# EasyEDA Pro project ProPrj_K230_2026-10-28.epro, schematic 主板原理图, sheets 11 to 13 of 13

## Sheets
11 Power-0V8-1V1-1V8-3V3: Page Name: Power-0V8-1V1-1V8-3V3; Update Date: 2024-11-28
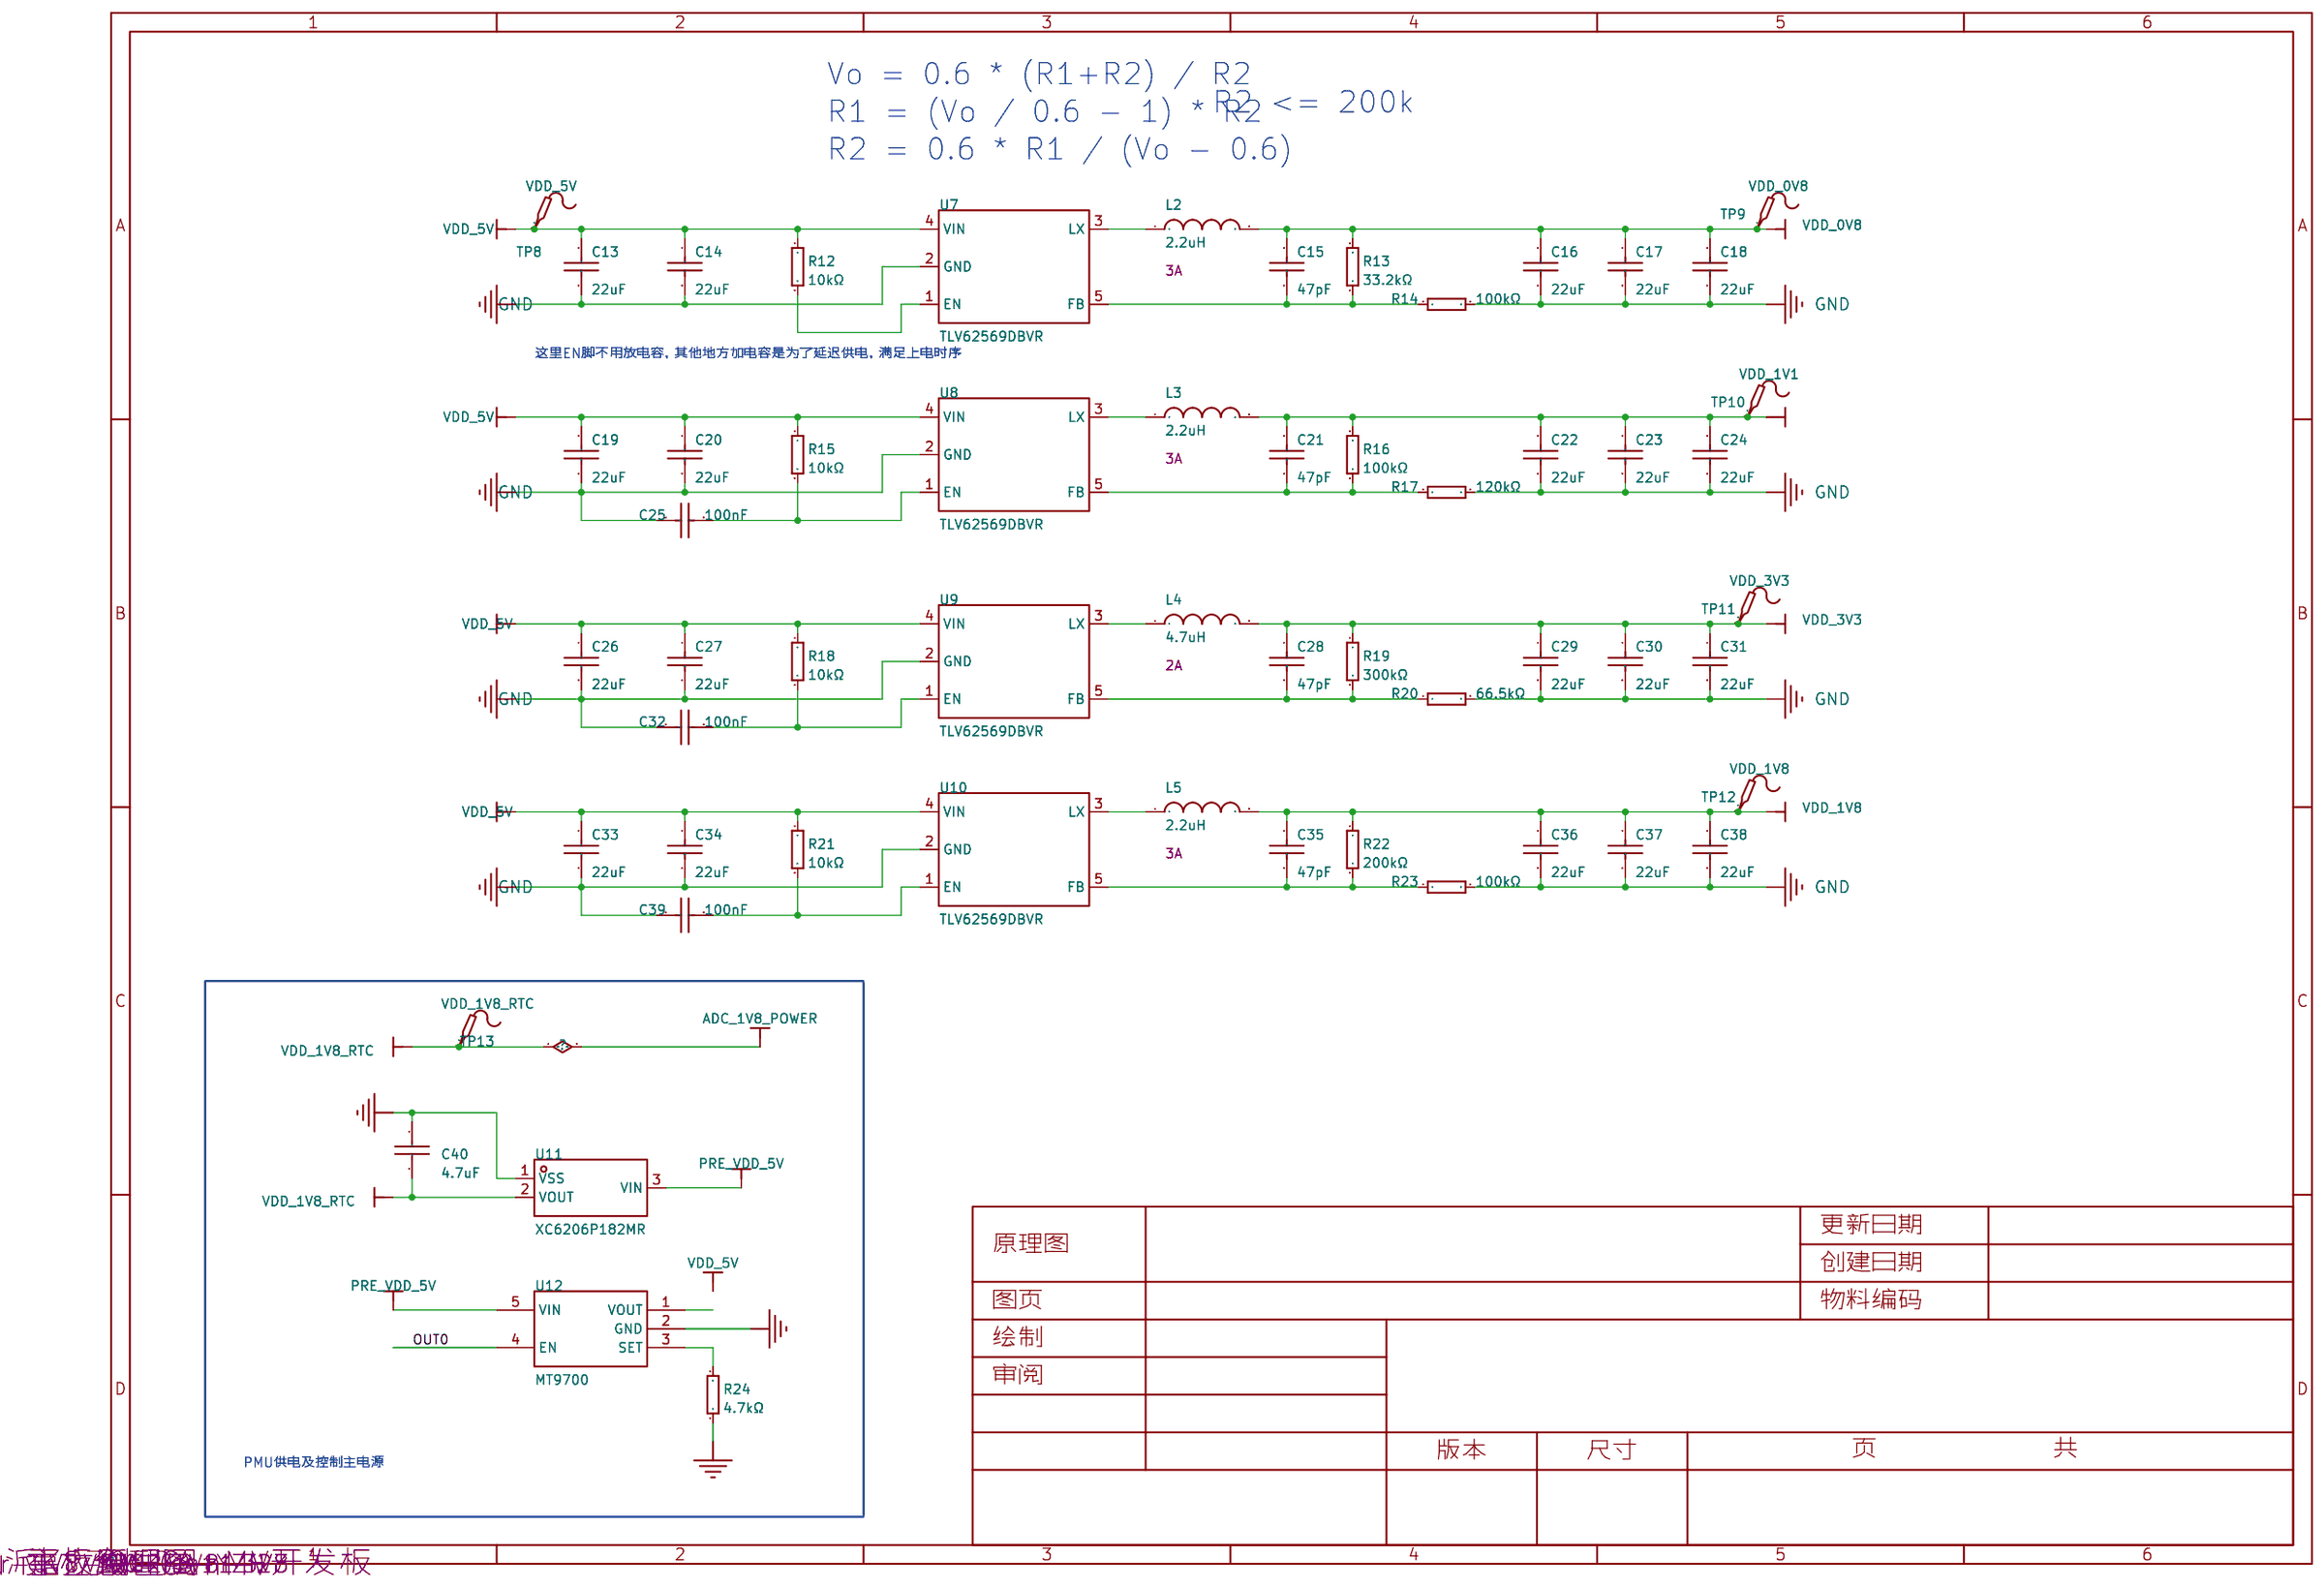
[diagram p10: Power-0V8-1V1-1V8-3V3]
12 K230 POWER: Page Name: K230 POWER; Update Date: 2024-11-28
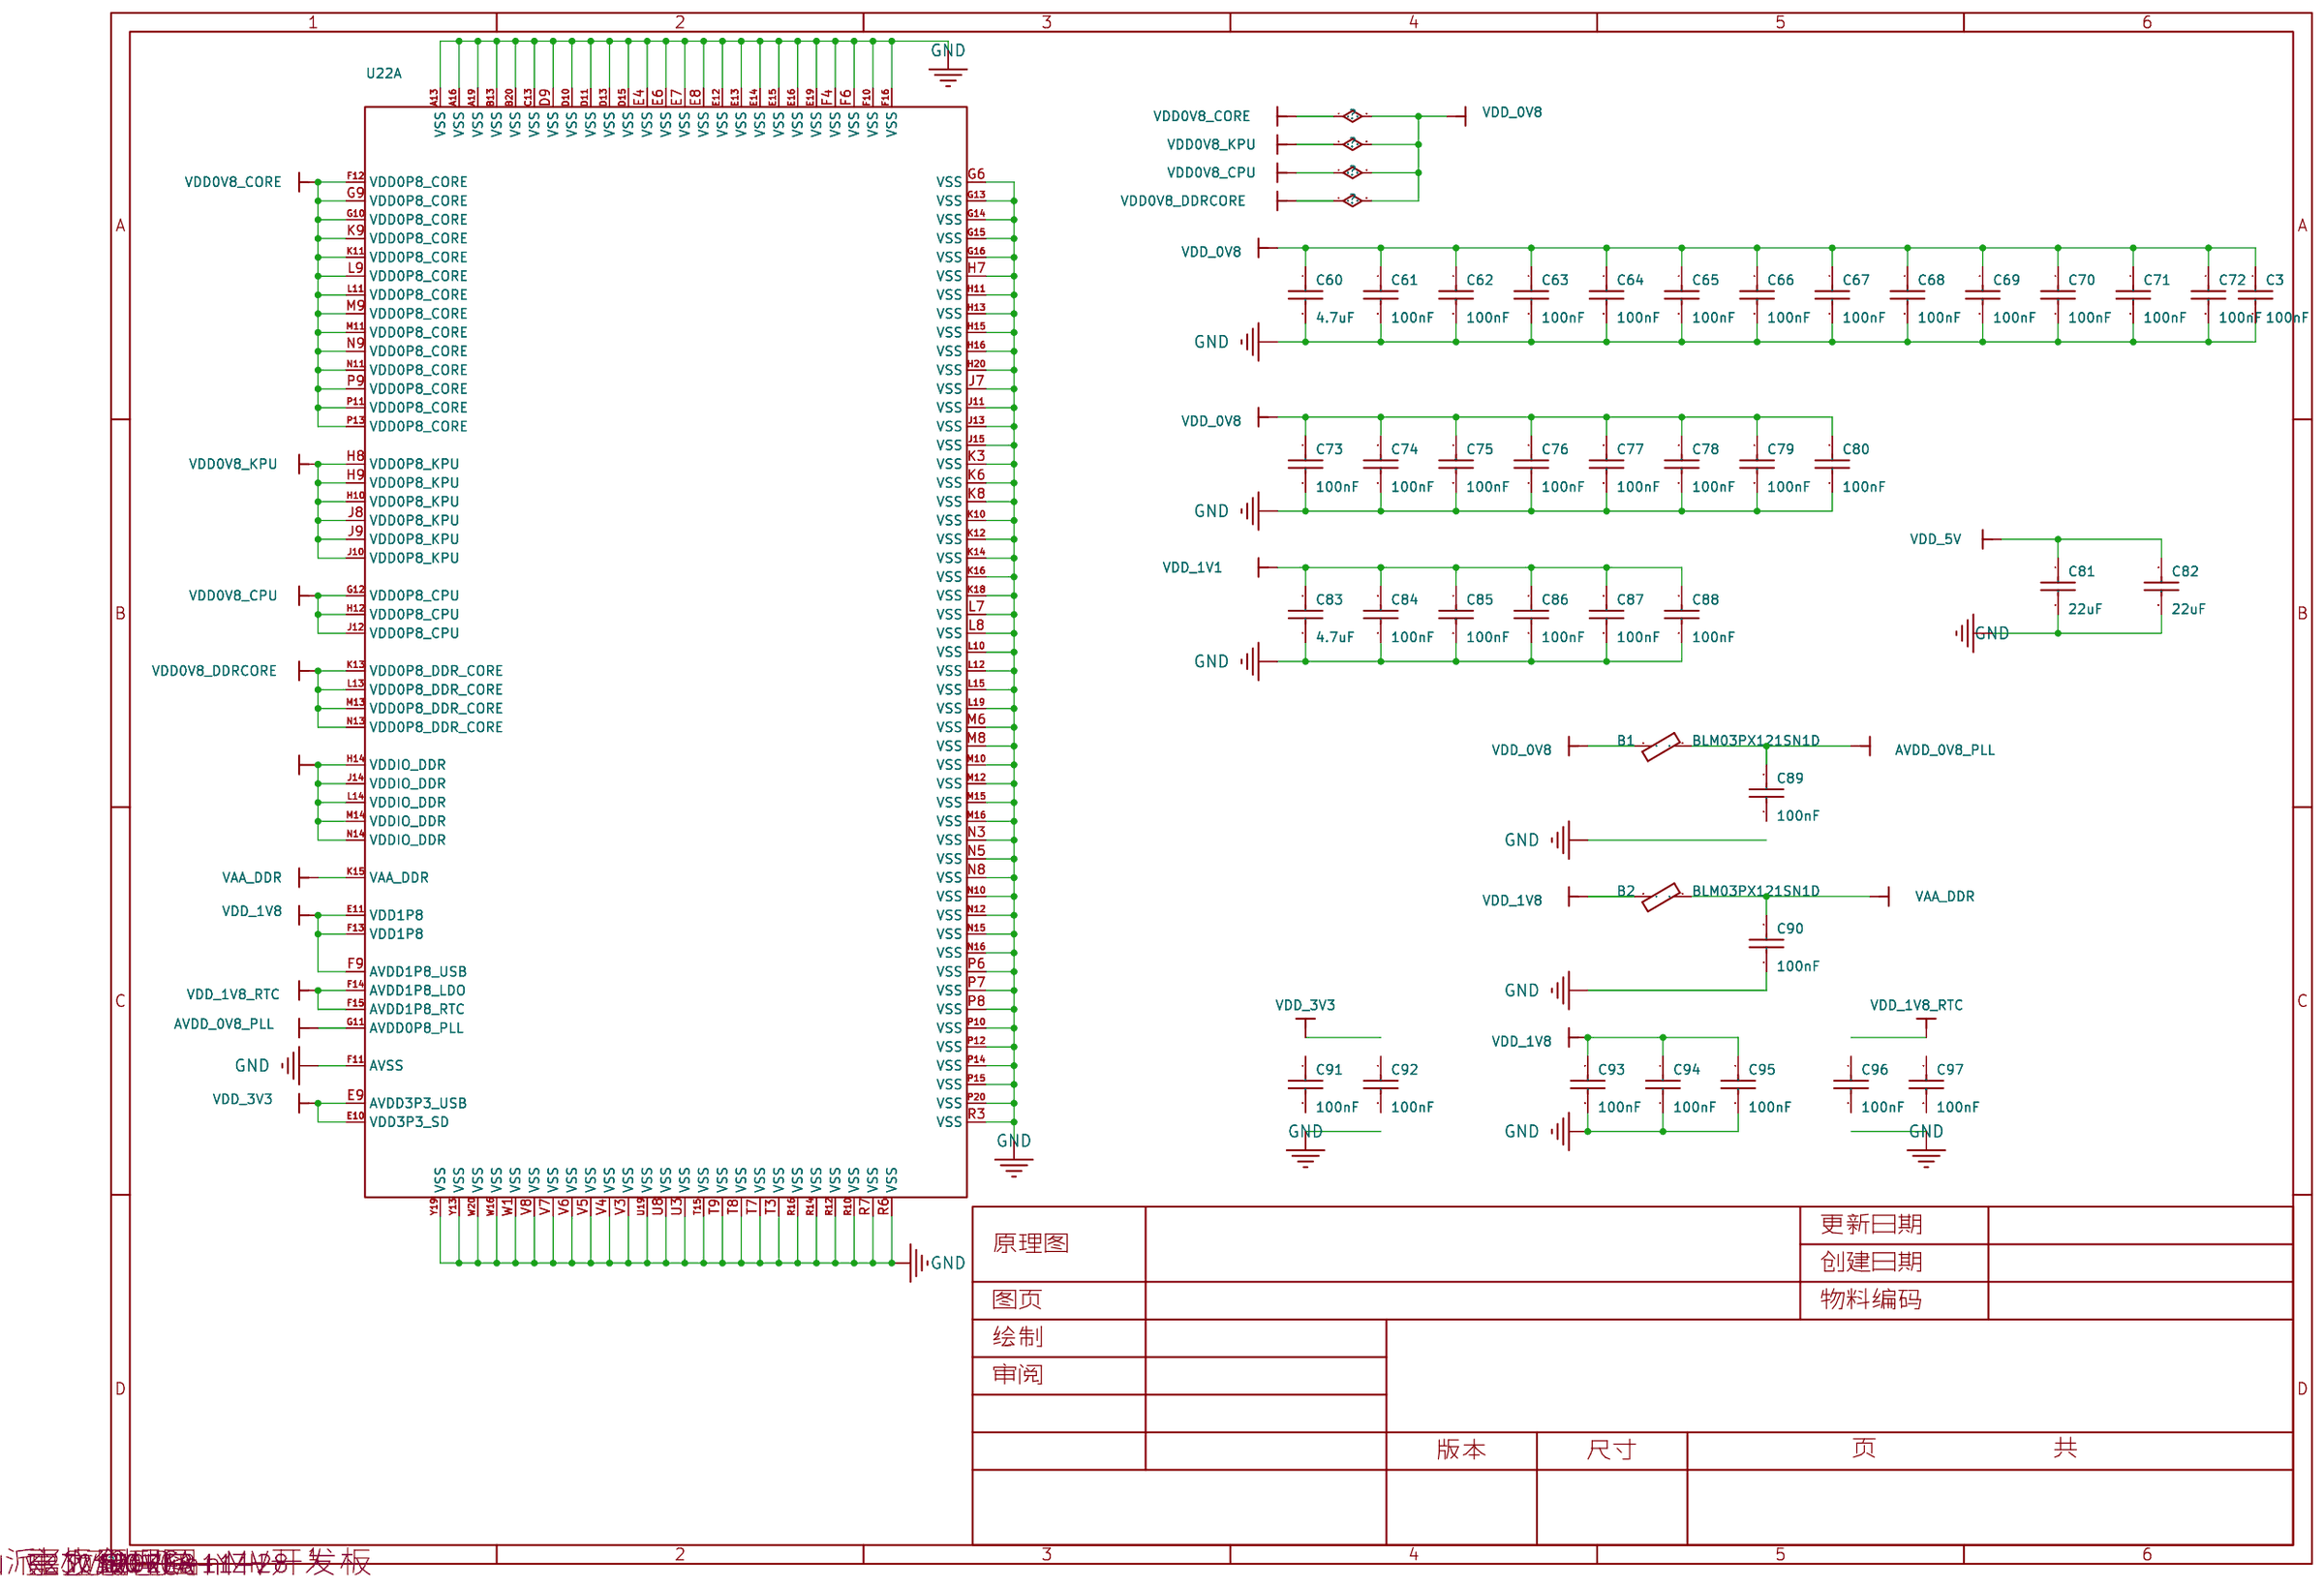
[diagram p11: K230 POWER]
13 LPDDR4 POWER: Page Name: LPDDR4 POWER; Update Date: 2024-11-28
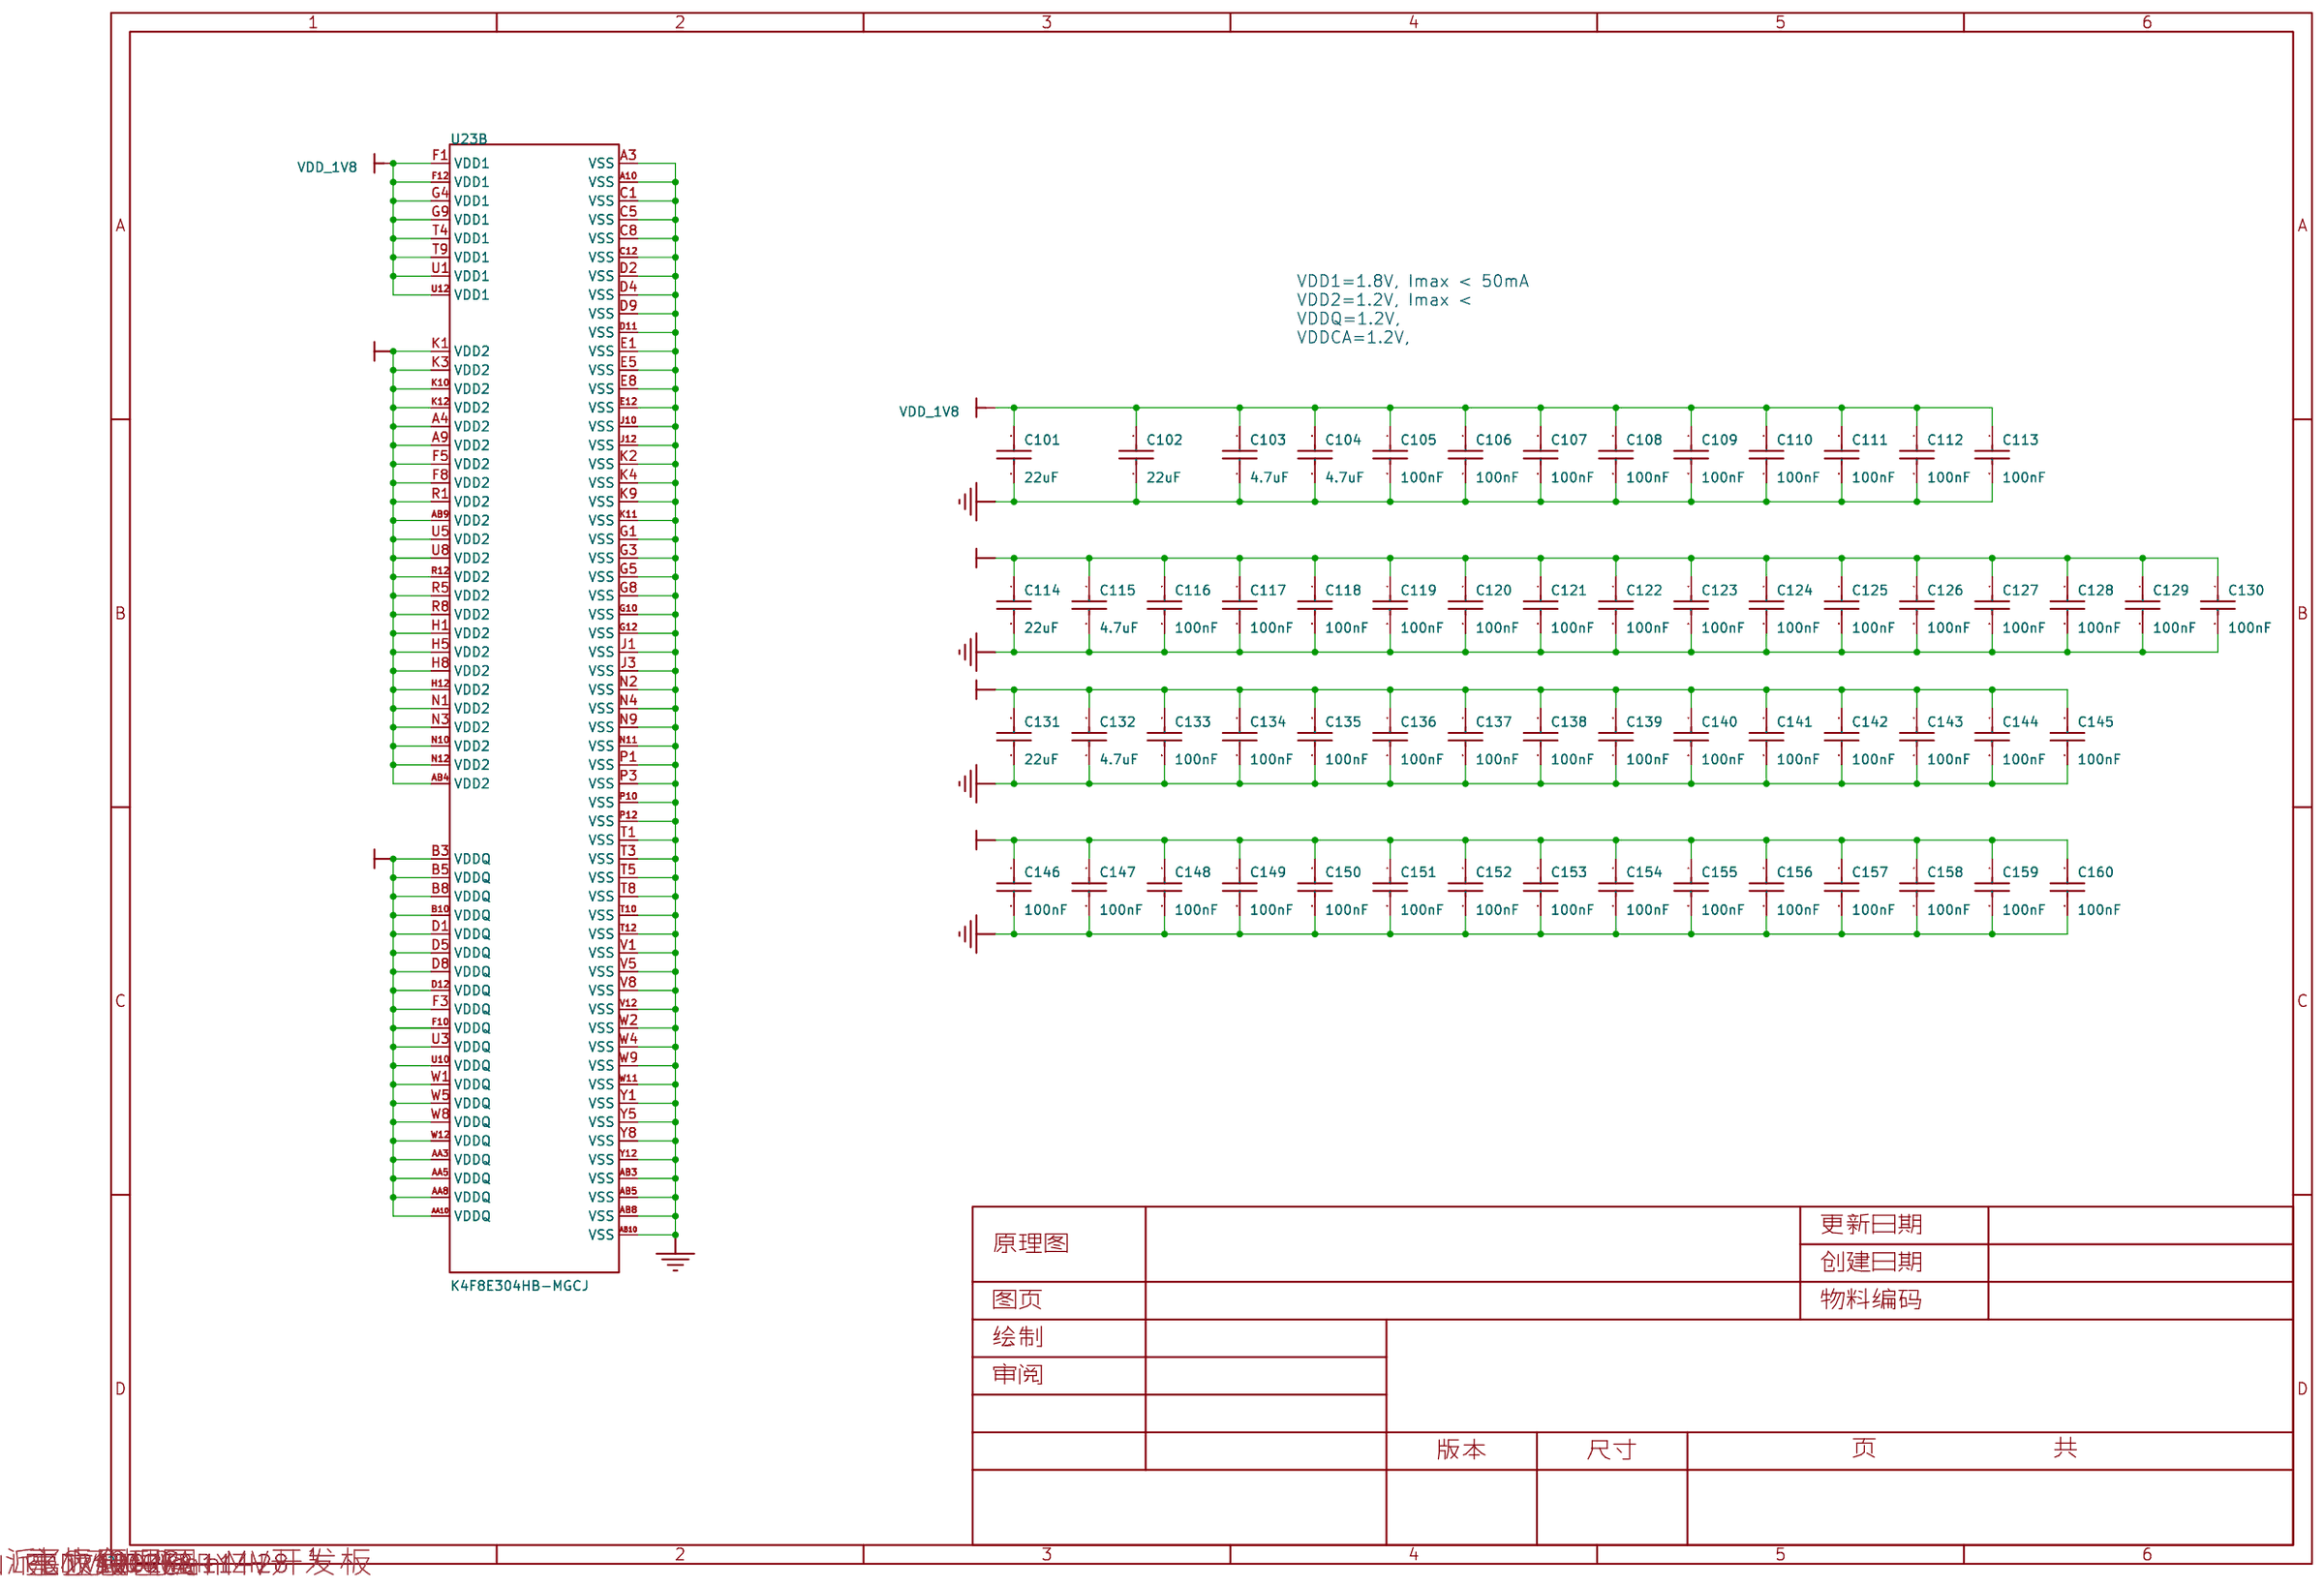
[diagram p12: LPDDR4 POWER]

## Parts
sheet K230 BOOT
U22  K230  [K230]  (sections 1,2,3,4,5)
sheet K230 POWER
B1  BLM03PX121SN1D  [R0201_1]
B2  BLM03PX121SN1D  [R0201_1]
C3  100nF  [R0201]
C60  4.7uF  [R0402]
C61  100nF  [R0201]
C62  100nF  [R0201]
C63  100nF  [R0201]
C64  100nF  [R0201]
C65  100nF  [R0201]
C66  100nF  [R0201]
C67  100nF  [R0201]
C68  100nF  [R0201]
C69  100nF  [R0201]
C70  100nF  [R0201]
C71  100nF  [R0201]
C72  100nF  [R0201]
C73  100nF  [R0201]
C74  100nF  [R0201]
C75  100nF  [R0201]
C76  100nF  [R0201]
C77  100nF  [R0201]
C78  100nF  [R0201]
C79  100nF  [R0201]
C80  100nF  [R0201]
C81  22uF  [R0402]
C82  22uF  [R0402]
C83  4.7uF  [R0402]
C84  100nF  [R0201]
C85  100nF  [R0201]
C86  100nF  [R0201]
C87  100nF  [R0201]
C88  100nF  [R0201]
C89  100nF  [R0201]
C90  100nF  [R0201]
C91  100nF  [R0201]
C92  100nF  [R0201]
C93  100nF  [R0201]
C94  100nF  [R0201]
C95  100nF  [R0201]
C96  100nF  [R0201]
C97  100nF  [R0201]
sheet LPDDR4 POWER
C101  22uF  [R0603]
C102  22uF  [R0603]
C103  4.7uF  [R0402]
C104  4.7uF  [R0402]
C105  100nF  [R0402]
C106  100nF  [R0402]
C107  100nF  [R0402]
C108  100nF  [R0402]
C109  100nF  [R0402]
C110  100nF  [R0201]
C111  100nF  [R0201]
C112  100nF  [R0201]
C113  100nF  [R0201]
C114  22uF  [R0603]
C115  4.7uF  [R0603]
C116  100nF  [R0201]
C117  100nF  [R0201]
C118  100nF  [R0201]
C119  100nF  [R0201]
C120  100nF  [R0201]
C121  100nF  [R0201]
C122  100nF  [R0201]
C123  100nF  [R0201]
C124  100nF  [R0201]
C125  100nF  [R0201]
C126  100nF  [R0201]
C127  100nF  [R0201]
C128  100nF  [R0201]
C129  100nF  [R0201]
C130  100nF  [R0201]
C131  22uF  [R0603]
C132  4.7uF  [R0402]
C133  100nF  [R0201]
C134  100nF  [R0201]
C135  100nF  [R0201]
C136  100nF  [R0201]
C137  100nF  [R0201]
C138  100nF  [R0201]
C139  100nF  [R0201]
C140  100nF  [R0201]
C141  100nF  [R0201]
C142  100nF  [R0201]
C143  100nF  [R0201]
C144  100nF  [R0201]
C145  100nF  [R0201]
C146  100nF  [R0402]
C147  100nF  [R0402]
C148  100nF  [R0402]
C149  100nF  [R0402]
C150  100nF  [R0402]
C151  100nF  [R0402]
C152  100nF  [R0402]
C153  100nF  [R0402]
C154  100nF  [R0201]
C155  100nF  [R0201]
C156  100nF  [R0201]
C157  100nF  [R0201]
C158  100nF  [R0201]
C159  100nF  [R0201]
C160  100nF  [R0201]
sheet LPDDR4
U23  K4F8E304HB-MGCJ  [BGA-200_L15.0-W10.0_K4F8E304HB-MGCJ]  (sections A,B)
sheet Power-0V8-1V1-1V8-3V3
C13  22uF  [R0603]
C14  22uF  [R0603]
C15  47pF  [R0402]
C16  22uF  [R0603]
C17  22uF  [R0603]
C18  22uF  [R0603]
C19  22uF  [R0603]
C20  22uF  [R0603]
C21  47pF  [R0402]
C22  22uF  [R0603]
C23  22uF  [R0603]
C24  22uF  [R0603]
C25  100nF  [R0402]
C26  22uF  [R0603]
C27  22uF  [R0603]
C28  47pF  [R0402]
C29  22uF  [R0603]
C30  22uF  [R0603]
C31  22uF  [R0603]
C32  100nF  [R0402]
C33  22uF  [R0603]
C34  22uF  [R0603]
C35  47pF  [R0402]
C36  22uF  [R0603]
C37  22uF  [R0603]
C38  22uF  [R0603]
C39  100nF  [R0402]
C40  4.7uF  [R0402]
L2  2.2uH  [IND-SMD_L2.5-W2.0_MHCHL2520]
L3  2.2uH  [IND-SMD_L2.5-W2.0_MHCHL2520]
L4  4.7uH  [IND-SMD_L2.5-W2.0-VLS252012CX-150M]
L5  2.2uH  [IND-SMD_L2.5-W2.0_MHCHL2520]
R12  10kΩ  [R0402]
R13  33.2kΩ  [R0402]
R14  100kΩ  [R0402]
R15  10kΩ  [R0402]
R16  100kΩ  [R0402]
R17  120kΩ  [R0402]
R18  10kΩ  [R0402]
R19  300kΩ  [R0402]
R20  66.5kΩ  [R0402]
R21  10kΩ  [R0402]
R22  200kΩ  [R0402]
R23  100kΩ  [R0402]
R24  4.7kΩ  [R0402]
TP8  VDD_5V  [Test-Point-0.5mm]
TP9  VDD_0V8  [Test-Point-0.5mm]
TP10  VDD_1V1  [Test-Point-0.5mm]
TP11  VDD_3V3  [Test-Point-0.5mm]
TP12  VDD_1V8  [Test-Point-0.5mm]
TP13  VDD_1V8_RTC  [Test-Point-0.5mm]
U7  TLV62569DBVR  [SOT23-5]
U8  TLV62569DBVR  [SOT23-5]
U9  TLV62569DBVR  [SOT23-5]
U10  TLV62569DBVR  [SOT23-5]
U11  XC6206P182MR  [SOT-23-3_L3.0-W1.7-P0.95-LS2.9-BR]
U12  MT9700  [SOT-23-5_L3.0-W1.7-P0.95-LS2.8-BR]

## Library data of the parts
U22 = K230: Supplier Part: C21264502; Manufacturer: Canaan(嘉楠); Supplier Footprint: BGA-390(13x13); JLCPCB Part Class: Extended Part; Datasheet: https://atta.szlcsc.com/upload/public/pdf/source/20240304/CED0BDC8B8BEDC72BFC23F1C8A2ED83A.pdf; Supplier: LCSC; Check: false
B1 B2 = BLM03PX121SN1D: 标称阻抗@测试频率:120Ω@100MHz;误差:±25%;直流电阻(RDC):160mΩ;; LCSC Part Name: 单路 0201磁珠 阻抗120Ω@100MHz; Supplier Part: C525479; Manufacturer: muRata(村田); Supplier Footprint: 0201; JLCPCB Part Class: Extended Part; Datasheet: https://atta.szlcsc.com/upload/public/pdf/source/20200424/C521135_3D661A3521BD96777A1D2DEE005F5276.pdf; Supplier: LCSC; Impedance @ Frequency: 120Ω@100MHz; Tolerance: ±25%; DC Resistance: 160mΩ; Current Rating: 700mA; Circuits: 1; Check: false
C3 C61-C80 C84-C97 C110-C113 C116-C130 C133-C145 C154-C160 = GRM033R61A104KE15D: 容值:100nF;精度:±10%;额定电压:10V;材质(温度系数):X5R;; LCSC Part Name: 100nF ±10% 10V; Supplier Part: C76934; Manufacturer: muRata(村田); Supplier Footprint: 0201; JLCPCB Part Class: Extended Part; Datasheet: https://atta.szlcsc.com/upload/public/pdf/source/20180307/C76934_15204090982891407723.pdf; Supplier: LCSC; Tolerance: ±10%; Voltage Rated: 10V; Temperature Coefficient: X5R
C40 C60 C83 C103 C104 C115 C132 = CL05A475MP5NRNC: 容值:4.7uF;精度:±20%;额定电压:10V;材质(温度系数):X5R;; LCSC Part Name: 4.7uF ±20% 10V; Supplier Part: C23733; Manufacturer: SAMSUNG(三星); Supplier Footprint: 0402; JLCPCB Part Class: Basic Part; Datasheet: https://atta.szlcsc.com/upload/public/pdf/source/20160218/1457707763339.pdf; Supplier: LCSC; Tolerance: ±20%; Voltage Rated: 10V; Temperature Coefficient: X5R; Check: false
C81 C82 = GRM155R60J226ME11D: 容值:22uF;精度:±20%;额定电压:6.3V;材质(温度系数):X5R;; LCSC Part Name: 22uF ±20% 6.3V; Supplier Part: C415703; Manufacturer: muRata(村田); Supplier Footprint: 0402; JLCPCB Part Class: Extended Part; Datasheet: https://atta.szlcsc.com/upload/public/pdf/source/20200305/C490387_23319AE8C154DEB24C505E6C82A8106A.pdf; Supplier: LCSC; Tolerance: ±20%; Voltage Rated: 6.3V; Temperature Coefficient: X5R; Check: false
C13 C14 C16-C20 C22-C24 C26 C27 C29-C31 C33 C34 C36-C38 C101 C102 C114 C131 = CL10A226MP8NUNE: 容值:22uF;精度:±20%;额定电压:10V;材质(温度系数):X5R;; LCSC Part Name: 22uF ±20% 10V; Supplier Part: C86295; Manufacturer: SAMSUNG(三星); Supplier Footprint: 0603; JLCPCB Part Class: 扩展库; Datasheet: https://atta.szlcsc.com/upload/public/pdf/source/20160218/1457707763339.pdf; Supplier: LCSC; Tolerance: ±20%; Voltage Rated: 10V; Temperature Coefficient: X5R; Check: false
C25 C32 C39 C105-C109 C146-C153 = CL05B104KO5NNNC: 容值:100nF;精度:±10%;额定电压:16V;材质(温度系数):X7R;; LCSC Part Name: 100nF ±10% 16V; Supplier Part: C1525; Manufacturer: SAMSUNG(三星); Supplier Footprint: 0402; JLCPCB Part Class: Basic Part; Datasheet: https://atta.szlcsc.com/upload/public/pdf/source/20160218/1457707763339.pdf; Supplier: LCSC; Tolerance: ±10%; Voltage Rated: 16V; Temperature Coefficient: X7R; Check: false
U23 = K4F8E304HB-MGCJ: LPDDR4-x32; Supplier Part: C2803257; Supplier Footprint: TFBGA-200; JLCPCB Part Class: Extended Part; Supplier: LCSC; Check: false
C15 C21 C28 C35 = 0402CG470J500NT: 容值:47pF;精度:±5%;额定电压:50V;材质(温度系数):C0G;; LCSC Part Name: 47pF ±5% 50V; Supplier Part: C1567; Manufacturer: FH(风华); Supplier Footprint: 0402; JLCPCB Part Class: Basic Part; Datasheet: https://atta.szlcsc.com/upload/public/pdf/source/20200305/C486355_26A10D38EF8C2A5C37091D0039909270.pdf; Supplier: LCSC; Tolerance: ±5%; Voltage Rated: 50V; Temperature Coefficient: C0G; Check: false
L2 L3 L5 = FTC252012S2R2MBCA: 电感值:2.2uH;精度:±20%;额定电流:3A;饱和电流(Isat):3.8A;类型:一体成型电感;; LCSC Part Name: 2.2uH ±20% 3.8A; Supplier Part: C5832372; Manufacturer: cjiang(长江微电); Supplier Footprint: 1008; JLCPCB Part Class: Extended Part; Datasheet: https://atta.szlcsc.com/upload/public/pdf/source/20230602/8FFEDA9C0247A92A0D4B67554BFE4091.pdf; Supplier: LCSC; Tolerance: ±20%; Rated Current: 3A; Saturation Current (Isat): 3.8A; DC Resistance (DCR): 55mΩ; Type: 一体成型电感
L4 = FTC252010S4R7MBCA: 电感值:4.7uH;精度:±20%;额定电流:2A;饱和电流(Isat):2.6A;类型:一体成型电感;; LCSC Part Name: 4.7uH ±20% 2.6A; Supplier Part: C5832360; Manufacturer: cjiang(长江微电); Supplier Footprint: SMD,2x2.5mm; JLCPCB Part Class: Extended Part; Datasheet: https://atta.szlcsc.com/upload/public/pdf/source/20230602/8FFEDA9C0247A92A0D4B67554BFE4091.pdf; Supplier: LCSC; Tolerance: ±20%; Rated Current: 2A; Saturation Current (Isat): 2.6A; DC Resistance (DCR): 160mΩ; Type: 一体成型电感
R12 R15 R18 R21 = 0402WGF1002TCE: 电阻类型:厚膜电阻;阻值:10kΩ;精度:±1%;功率:62.5mW;最大工作电压:50V;温度系数:±100ppm/℃;; LCSC Part Name: 10kΩ ±1% 62.5mW 厚膜电阻; Supplier Part: C25744; Manufacturer: UNI-ROYAL(厚声); Supplier Footprint: 0402; JLCPCB Part Class: 基础库; Datasheet: https://atta.szlcsc.com/upload/public/pdf/source/20200306/C422600_1E6D84923E4A46A82E41ADD87F860B5C.pdf; Supplier: LCSC; Type: 厚膜电阻; Tolerance: ±1%; Power(Watts): 62.5mW; Overload Voltage (Max): 50V; Temperature Coefficient: ±100ppm/℃; Operating Temperature Range: -55℃~+155℃; Check: false
R13 = RC0402FR-0733K2L: 电阻类型:厚膜电阻;阻值:33.2kΩ;精度:±1%;功率:62.5mW;最大工作电压:50V;温度系数:±100ppm/℃;; LCSC Part Name: 厚膜电阻 33.2kΩ ±1% 62.5mW; Supplier Part: C130276; Manufacturer: YAGEO(国巨); Supplier Footprint: 0402; JLCPCB Part Class: Extended Part; Datasheet: https://atta.szlcsc.com/upload/public/pdf/source/20180904/C276339_014E484F1DBA106FB92D45EABD5A1AC1.pdf; Supplier: LCSC; Type: 厚膜电阻; Tolerance: ±1%; Power(Watts): 62.5mW; Overload Voltage (Max): 50V; Temperature Coefficient: ±100ppm/℃; Operating Temperature Range: -55℃~+155℃; Check: false
R14 R16 R23 = 0402WGF1003TCE: 电阻类型:厚膜电阻;阻值:100kΩ;精度:±1%;功率:62.5mW;最大工作电压:50V;温度系数:±100ppm/℃;; LCSC Part Name: 100kΩ ±1% 62.5mW; Supplier Part: C25741; Manufacturer: UNI-ROYAL(厚声); Supplier Footprint: 0402; JLCPCB Part Class: Basic Part; Datasheet: https://atta.szlcsc.com/upload/public/pdf/source/20200306/C422600_1E6D84923E4A46A82E41ADD87F860B5C.pdf; Supplier: LCSC; Type: 厚膜电阻; Tolerance: ±1%; Power(Watts): 62.5mW; Temperature Coefficient: ±100ppm/℃; Overload Voltage (Max): 50V; Operating Temperature Range: -55℃~+155℃; Check: false
R17 = 0402WGF1203TCE: 电阻类型:厚膜电阻;阻值:120kΩ;精度:±1%;功率:62.5mW;最大工作电压:50V;温度系数:±100ppm/℃;; LCSC Part Name: 120kΩ ±1% 62.5mW 厚膜电阻; Supplier Part: C25750; Manufacturer: UNI-ROYAL(厚声); Supplier Footprint: 0402; JLCPCB Part Class: Extended Part; Datasheet: https://atta.szlcsc.com/upload/public/pdf/source/20200306/C422600_1E6D84923E4A46A82E41ADD87F860B5C.pdf; Supplier: LCSC; Type: 厚膜电阻; Tolerance: ±1%; Power(Watts): 62.5mW; Overload Voltage (Max): 50V; Temperature Coefficient: ±100ppm/℃; Operating Temperature Range: -55℃~+155℃; Check: false
R19 = 0402WGF3003TCE: 电阻类型:厚膜电阻;阻值:300kΩ;精度:±1%;功率:62.5mW;最大工作电压:50V;温度系数:±100ppm/℃;; LCSC Part Name: 300kΩ ±1% 62.5mW 厚膜电阻; Supplier Part: C25774; Manufacturer: UNI-ROYAL(厚声); Supplier Footprint: 0402; JLCPCB Part Class: Extended Part; Datasheet: https://atta.szlcsc.com/upload/public/pdf/source/20200306/C422600_1E6D84923E4A46A82E41ADD87F860B5C.pdf; Supplier: LCSC; Type: 厚膜电阻; Tolerance: ±1%; Power(Watts): 62.5mW; Overload Voltage (Max): 50V; Temperature Coefficient: ±100ppm/℃; Operating Temperature Range: -55℃~+155℃; Check: false
R20 = 0402WGF6652TCE: 电阻类型:厚膜电阻;阻值:66.5kΩ;精度:±1%;功率:62.5mW;最大工作电压:50V;温度系数:±100ppm/℃;; LCSC Part Name: 66.5kΩ ±1% 62.5mW 厚膜电阻; Supplier Part: C29381; Manufacturer: UNI-ROYAL(厚声); Supplier Footprint: 0402; JLCPCB Part Class: Extended Part; Datasheet: https://atta.szlcsc.com/upload/public/pdf/source/20200306/C422600_1E6D84923E4A46A82E41ADD87F860B5C.pdf; Supplier: LCSC; Type: 厚膜电阻; Tolerance: ±1%; Power(Watts): 62.5mW; Overload Voltage (Max): 50V; Temperature Coefficient: ±100ppm/℃; Operating Temperature Range: -55℃~+155℃; Check: false
R22 = 0402WGF2003TCE: 电阻类型:厚膜电阻;阻值:200kΩ;精度:±1%;功率:62.5mW;最大工作电压:50V;温度系数:±100ppm/℃;; LCSC Part Name: 200kΩ ±1% 62.5mW 厚膜电阻; Supplier Part: C25764; Manufacturer: UNI-ROYAL(厚声); Supplier Footprint: 0402; JLCPCB Part Class: Basic Part; Datasheet: https://atta.szlcsc.com/upload/public/pdf/source/20200306/C422600_1E6D84923E4A46A82E41ADD87F860B5C.pdf; Supplier: LCSC; Type: 厚膜电阻; Tolerance: ±1%; Power(Watts): 62.5mW; Overload Voltage (Max): 50V; Temperature Coefficient: ±100ppm/℃; Operating Temperature Range: -55℃~+155℃; Check: false
R24 = 0402WGF4701TCE: 电阻类型:厚膜电阻;阻值:4.7kΩ;精度:±1%;功率:62.5mW;最大工作电压:50V;温度系数:±100ppm/℃;; LCSC Part Name: 4.7kΩ ±1% 62.5mW 厚膜电阻; Supplier Part: C25900; Manufacturer: UNI-ROYAL(厚声); Supplier Footprint: 0402; JLCPCB Part Class: Basic Part; Datasheet: https://atta.szlcsc.com/upload/public/pdf/source/20200306/C422600_1E6D84923E4A46A82E41ADD87F860B5C.pdf; Supplier: LCSC; Type: 厚膜电阻; Tolerance: ±1%; Power(Watts): 62.5mW; Overload Voltage (Max): 50V; Temperature Coefficient: ±100ppm/℃; Operating Temperature Range: -55℃~+155℃; Check: false
TP8-TP13 = Test-Point: Test Point 测试点
U7-U10 = TLV62569DBVR: 功能类型:降压型;输出类型:可调;输入电压:2.5V~5.5V;输出电压:600mV~5.5V;输出电流(最大值):2A;; Supplier Part: C141836; Manufacturer: TI(德州仪器); Supplier Footprint: SOT-23-5; JLCPCB Part Class: Extended Part; Datasheet: https://www.ti.com/cn/lit/gpn/tlv62569; Supplier: LCSC; Function: 降压型; Output Type: 可调; Input Voltage: 2.5V~5.5V; Output Voltage: 600mV~5.5V; Output Current (Max): 2A; Switching Frequency: 1.5MHz; Operating Temperature: -40℃~+125℃@(TJ); Synchronous Rectification: 是; Topology: 降压式; Switch tube (built-in/external): 内置; Check: false
U11 = XC6206P182MR_C347373: 输出类型:固定;最大输入电压:8V;输出电压:1.8V;输出电流:250mA;电源纹波抑制比(PSRR):40dB@(1kHz);输出极性:正;; LCSC Part Name: 输入8V 输出1.8V 250mA; Supplier Part: C347373; Manufacturer: UMW(友台半导体); Supplier Footprint: SOT-23; JLCPCB Part Class: 扩展库; Datasheet: https://atta.szlcsc.com/upload/public/pdf/source/20231109/6B10DA60E52FC900BF97E3EFEB5D6341.pdf; Supplier: LCSC; Output Type: 固定; Maximum Input Voltage: 8V; Output Voltage: 1.8V; Output Current: 250mA; Power Supply Rejection Ratio (PSRR): 40dB@(1kHz); Dropout Voltage: 280mV@(50mA); Output Polarity: 正; Number of Outputs: 1
U12 = MT9700: 低功耗负载开关/USB电源开关/限流保护开关; Supplier Part: C89855; Manufacturer: 西安航天民芯; Supplier Footprint: SOT-23-5; JLCPCB Part Class: 扩展库; Datasheet: https://atta.szlcsc.com/upload/public/pdf/source/20170418/1492481333031.pdf; Supplier: LCSC

## Nets
AVDD_0V8_PLL: B1.2 C89.1 U22.G11(AVDD0P8_PLL)
GND: C3.2 C13.2 C14.2 C16.2 C17.2 C18.2 C19.2 C20.2 C22.2 C23.2 C24.2 C25.1 C26.2 C27.2 C29.2 C30.2 C31.2 C32.1 C33.2 C34.2 C36.2 C37.2 C38.2 C39.1 C40.1 C60.2 C61.2 C62.2 C63.2 C64.2 C65.2 C66.2 C67.2 C68.2 C69.2 C70.2 C71.2 C72.2 C73.2 C74.2 C75.2 C76.2 C77.2 C78.2 C79.2 C80.2 C81.2 C82.2 C83.2 C84.2 C85.2 C86.2 C87.2 C88.2 C89.2 C90.2 C91.2 C92.2 C93.2 C94.2 C95.2 C96.2 C97.2 C101.2 C102.2 C103.2 C104.2 C105.2 C106.2 C107.2 C108.2 C109.2 C110.2 C111.2 C112.2 C113.2 C114.2 C115.2 C116.2 C117.2 C118.2 C119.2 C120.2 C121.2 C122.2 C123.2 C124.2 C125.2 C126.2 C127.2 C128.2 C129.2 C130.2 C131.2 C132.2 C133.2 C134.2 C135.2 C136.2 C137.2 C138.2 C139.2 C140.2 C141.2 C142.2 C143.2 C144.2 C145.2 C146.2 C147.2 C148.2 C149.2 C150.2 C151.2 C152.2 C153.2 C154.2 C155.2 C156.2 C157.2 C158.2 C159.2 C160.2 R14.2 R17.2 R20.2 R23.2 R24.2 U7.2(GND) U8.2(GND) U9.2(GND) U10.2(GND) U11.1(VSS) U12.2(GND) U22.A13(VSS) U22.A16(VSS) U22.A19(VSS) U22.B13(VSS) U22.B20(VSS) U22.C13(VSS) U22.D9(VSS) U22.D10(VSS) U22.D11(VSS) U22.D13(VSS) U22.D15(VSS) U22.E4(VSS) U22.E6(VSS) U22.E7(VSS) U22.E8(VSS) U22.E12(VSS) U22.E13(VSS) U22.E14(VSS) U22.E15(VSS) U22.E16(VSS) U22.E19(VSS) U22.F4(VSS) U22.F6(VSS) U22.F10(VSS) U22.F11(AVSS) U22.F16(VSS) U22.G6(VSS) U22.G13(VSS) U22.G14(VSS) U22.G15(VSS) U22.G16(VSS) U22.H7(VSS) U22.H11(VSS) U22.H13(VSS) U22.H15(VSS) U22.H16(VSS) U22.H20(VSS) U22.J7(VSS) U22.J11(VSS) U22.J13(VSS) U22.J15(VSS) U22.K3(VSS) U22.K6(VSS) U22.K8(VSS) U22.K10(VSS) U22.K12(VSS) U22.K14(VSS) U22.K16(VSS) U22.K18(VSS) U22.L7(VSS) U22.L8(VSS) U22.L10(VSS) U22.L12(VSS) U22.L15(VSS) U22.L19(VSS) U22.M6(VSS) U22.M8(VSS) U22.M10(VSS) U22.M12(VSS) U22.M15(VSS) U22.M16(VSS) U22.N3(VSS) U22.N5(VSS) U22.N8(VSS) U22.N10(VSS) U22.N12(VSS) U22.N15(VSS) U22.N16(VSS) U22.P6(VSS) U22.P7(VSS) U22.P8(VSS) U22.P10(VSS) U22.P12(VSS) U22.P14(VSS) U22.P15(VSS) U22.P20(VSS) U22.R3(VSS) U22.R6(VSS) U22.R7(VSS) U22.R10(VSS) U22.R12(VSS) U22.R14(VSS) U22.R16(VSS) U22.T3(VSS) U22.T7(VSS) U22.T8(VSS) U22.T9(VSS) U22.T15(VSS) U22.U3(VSS) U22.U8(VSS) U22.U19(VSS) U22.V3(VSS) U22.V4(VSS) U22.V5(VSS) U22.V6(VSS) U22.V7(VSS) U22.V8(VSS) U22.W1(VSS) U22.W16(VSS) U22.W20(VSS) U22.Y13(VSS) U22.Y19(VSS) U23.A3(VSS) U23.A10(VSS) U23.AB3(VSS) U23.AB5(VSS) U23.AB8(VSS) U23.AB10(VSS) U23.C1(VSS) U23.C5(VSS) U23.C8(VSS) U23.C12(VSS) U23.D2(VSS) U23.D4(VSS) U23.D9(VSS) U23.D11(VSS) U23.E1(VSS) U23.E5(VSS) U23.E8(VSS) U23.E12(VSS) U23.G1(VSS) U23.G3(VSS) U23.G5(VSS) U23.G8(VSS) U23.G10(VSS) U23.G12(VSS) U23.J1(VSS) U23.J3(VSS) U23.J10(VSS) U23.J12(VSS) U23.K2(VSS) U23.K4(VSS) U23.K9(VSS) U23.K11(VSS) U23.N2(VSS) U23.N4(VSS) U23.N9(VSS) U23.N11(VSS) U23.P1(VSS) U23.P3(VSS) U23.P10(VSS) U23.P12(VSS) U23.T1(VSS) U23.T3(VSS) U23.T5(VSS) U23.T8(VSS) U23.T10(VSS) U23.T12(VSS) U23.V1(VSS) U23.V5(VSS) U23.V8(VSS) U23.V12(VSS) U23.W2(VSS) U23.W4(VSS) U23.W9(VSS) U23.W11(VSS) U23.Y1(VSS) U23.Y5(VSS) U23.Y8(VSS) U23.Y12(VSS) ; also on sheet 2 3 4 5 6 8 9 10
VDD0V8_CORE: B1.1 C3.1 C15.1 C16.1 C17.1 C18.1 C60.1 C61.1 C62.1 C63.1 C64.1 C65.1 C66.1 C67.1 C68.1 C69.1 C70.1 C71.1 C72.1 C73.1 C74.1 C75.1 C76.1 C77.1 C78.1 C79.1 C80.1 L2.2 R13.1 TP9.1 U22.F12(VDD0P8_CORE) U22.G9(VDD0P8_CORE) U22.G10(VDD0P8_CORE) U22.G12(VDD0P8_CPU) U22.H8(VDD0P8_KPU) U22.H9(VDD0P8_KPU) U22.H10(VDD0P8_KPU) U22.H12(VDD0P8_CPU) U22.J8(VDD0P8_KPU) U22.J9(VDD0P8_KPU) U22.J10(VDD0P8_KPU) U22.J12(VDD0P8_CPU) U22.K9(VDD0P8_CORE) U22.K11(VDD0P8_CORE) U22.K13(VDD0P8_DDR_CORE) U22.L9(VDD0P8_CORE) U22.L11(VDD0P8_CORE) U22.L13(VDD0P8_DDR_CORE) U22.M9(VDD0P8_CORE) U22.M11(VDD0P8_CORE) U22.M13(VDD0P8_DDR_CORE) U22.N9(VDD0P8_CORE) U22.N11(VDD0P8_CORE) U22.N13(VDD0P8_DDR_CORE) U22.P9(VDD0P8_CORE) U22.P11(VDD0P8_CORE) U22.P13(VDD0P8_CORE) ; also on sheet 10
VDD_1V1: C21.1 C22.1 C23.1 C24.1 C83.1 C84.1 C85.1 C86.1 C87.1 C88.1 C114.1 C115.1 C116.1 C117.1 C118.1 C119.1 C120.1 C121.1 C122.1 C123.1 C124.1 C125.1 C126.1 C127.1 C128.1 C129.1 C130.1 C131.1 C132.1 C133.1 C134.1 C135.1 C136.1 C137.1 C138.1 C139.1 C140.1 C141.1 C142.1 C143.1 C144.1 C145.1 C146.1 C147.1 C148.1 C149.1 C150.1 C151.1 C152.1 C153.1 C154.1 C155.1 C156.1 C157.1 C158.1 C159.1 C160.1 L3.2 R16.1 TP10.1 U22.H14(VDDIO_DDR) U22.J14(VDDIO_DDR) U22.L14(VDDIO_DDR) U22.M14(VDDIO_DDR) U22.N14(VDDIO_DDR) U23.A4(VDD2) U23.A9(VDD2) U23.AA3(VDDQ) U23.AA5(VDDQ) U23.AA8(VDDQ) U23.AA10(VDDQ) U23.AB4(VDD2) U23.AB9(VDD2) U23.B3(VDDQ) U23.B5(VDDQ) U23.B8(VDDQ) U23.B10(VDDQ) U23.D1(VDDQ) U23.D5(VDDQ) U23.D8(VDDQ) U23.D12(VDDQ) U23.F3(VDDQ) U23.F5(VDD2) U23.F8(VDD2) U23.F10(VDDQ) U23.H1(VDD2) U23.H5(VDD2) U23.H8(VDD2) U23.H12(VDD2) U23.K1(VDD2) U23.K3(VDD2) U23.K10(VDD2) U23.K12(VDD2) U23.N1(VDD2) U23.N3(VDD2) U23.N10(VDD2) U23.N12(VDD2) U23.R1(VDD2) U23.R5(VDD2) U23.R8(VDD2) U23.R12(VDD2) U23.U3(VDDQ) U23.U5(VDD2) U23.U8(VDD2) U23.U10(VDDQ) U23.W1(VDDQ) U23.W5(VDDQ) U23.W8(VDDQ) U23.W12(VDDQ) ; also on sheet 9
VDD_1V8: B2.1 C35.1 C36.1 C37.1 C38.1 C93.1 C94.1 C95.1 C101.1 C102.1 C103.1 C104.1 C105.1 C106.1 C107.1 C108.1 C109.1 C110.1 C111.1 C112.1 C113.1 L5.2 R22.1 TP12.1 U22.E11(VDD1P8) U22.F9(AVDD1P8_USB) U22.F13(VDD1P8) U23.F1(VDD1) U23.F12(VDD1) U23.G4(VDD1) U23.G9(VDD1) U23.T4(VDD1) U23.T9(VDD1) U23.U1(VDD1) U23.U12(VDD1) ; also on sheet 8 10
VDD_3V3: C28.1 C29.1 C30.1 C31.1 C91.1 C92.1 L4.2 R19.1 TP11.1 U22.E9(AVDD3P3_USB) U22.E10(VDD3P3_SD) ; also on sheet 2 5 6 8 10
VDD_5V: C13.1 C14.1 C19.1 C20.1 C26.1 C27.1 C33.1 C34.1 C81.1 C82.1 R12.1 R15.1 R18.1 R21.1 TP8.1 U7.4(VIN) U8.4(VIN) U9.4(VIN) U10.4(VIN) U12.1(VOUT) ; also on sheet 8
ADC_1V8_POWER: C40.2 C96.1 C97.1 TP13.1 U11.2(VOUT) U22.F14(AVDD1P8_LDO) U22.F15(AVDD1P8_RTC) ; also on sheet 8
OUT0: U12.4(EN) ; also on sheet 8
PRE_VDD_5V: U11.3(VIN) U12.5(VIN) ; also on sheet 3 4
VAA_DDR: B2.2 C90.1 U22.K15(VAA_DDR)
$15N1263: L4.1 U9.3(LX)
$15N1265: C25.2 R15.2 U8.1(EN)
$15N1267: C21.2 R16.2 R17.1 U8.5(FB)
$15N1268: L3.1 U8.3(LX)
$15N1273: C32.2 R18.2 U9.1(EN)
$15N1274: C28.2 R19.2 R20.1 U9.5(FB)
$15N1275: L5.1 U10.3(LX)
$15N1277: C35.2 R22.2 R23.1 U10.5(FB)
$15N1278: C39.2 R21.2 U10.1(EN)
$15N1283: C15.2 R13.2 R14.1 U7.5(FB)
$15N1286: L2.1 U7.3(LX)
$15N1290: R12.2 U7.1(EN)
$15N4147: R24.1 U12.3(SET)

## Notes on the sheets
sheet 11
- Vo = 0.6 * (R1+R2) / R2
- R1 = (Vo / 0.6 - 1) * R2
- R2 <= 200k
- R2 = 0.6 * R1 / (Vo - 0.6)
- 这里EN脚不用放电容，其他地方加电容是为了延迟供电，满足上电时序
- PMU供电及控制主电源
sheet 13
- VDD1=1.8V, Imax < 50mA
  VDD2=1.2V, Imax <
  VDDQ=1.2V,
  VDDCA=1.2V,
